# Altium schematic sheet ETHERNET.SchDoc
size 558 x 431 mm; SheetNumber: 3; SheetTotal: 6; SPICEModelCacheANLGLSFY: <root> / <DocumentId>ANLGLSFY</DocumentId> / </root>
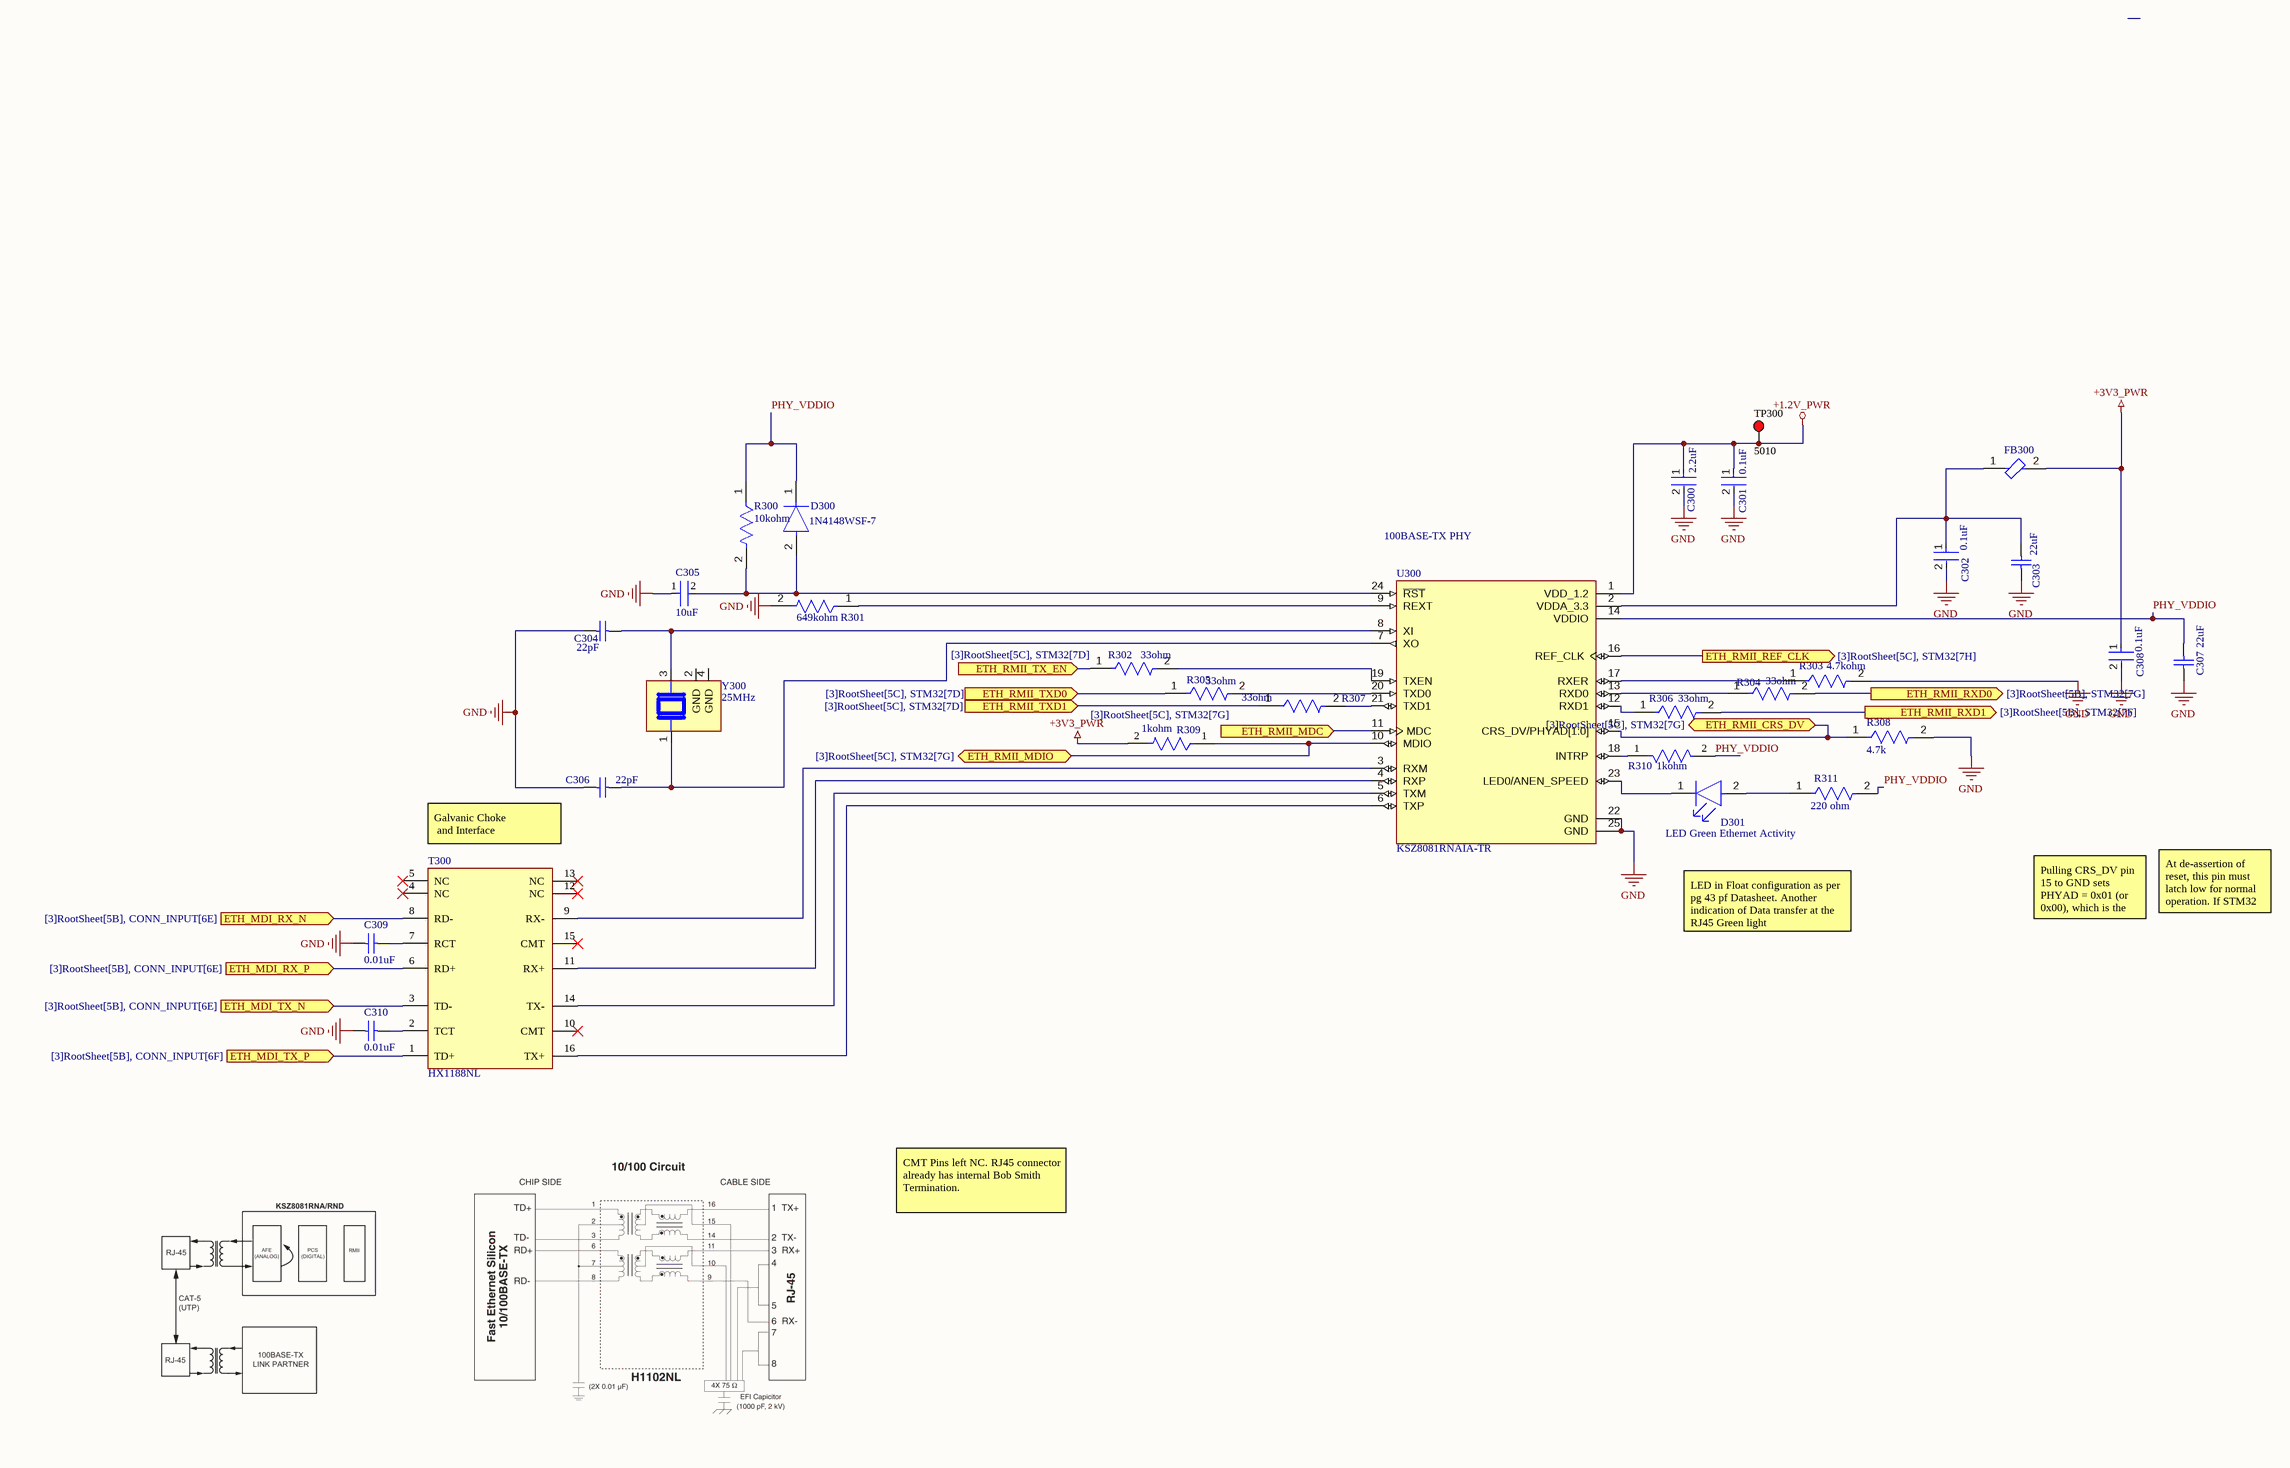
[diagram p0: ETHERNET.SchDoc]

## Parts
C300  2.2uF  [FP-CC0603-DC-MFG]
C301  0.1uF  [FP-GCM188-0_1-IPC_A]
C302  0.1uF  [FP-GCM188-0_1-IPC_A]
C303  22uF  [CAPC1608X90X35ML15T15]
C304  22pF  [CAPC1608X87X35LL15T15]
C305  10uF  [FP-CC0603-DC-MFG]
C306  22pF  [CAPC1608X87X35LL15T15]
C307  22uF  [CAPC1608X90X35ML15T15]
C308  0.1uF  [FP-GCM188-0_1-IPC_A]
C309  0.01uF  [CAPC0603(1608)100_L]
C310  0.01uF  [CAPC0603(1608)100_L]
D300  1N4148WSF-7  [FP-SOD323F-MFG]
D301  LED Green Ethernet Activity  [FP-APHD1608LZGCK-MFG]
FB300  BLM18PG121SN1D  [FP-BLM18-0_15-t0_8-IPC_A]  (value not drawn)
R300  10kohm  [FP-RC0603-0_55-IPC_C]
R301  649kohm  [FP-RT0603-MFG]
R302  33ohm  [FP-CRGCQ0603-IPC_C]
R303  4.7kohm  [FP-RMCF0603-IPC_B]
R304  33ohm  [FP-CRGCQ0603-IPC_C]
R305  33ohm  [FP-CRGCQ0603-IPC_C]
R306  33ohm  [FP-CRGCQ0603-IPC_C]
R307  33ohm  [FP-CRGCQ0603-IPC_C]
R308  4.7k  [FP-RMCF0603-IPC_B]
R309  1kohm  [FP-TFCR0603-MFG]
R310  1kohm  [FP-TFCR0603-MFG]
R311  220 ohm  [FP-RMCF0603-MFG]
T300  HX1188NL  [FP-HX1188NL-MFG]
TP300  5010  [KSTN-5010_V]
U300  KSZ8081RNAIA-TR  [QFN50P400X400X90-25N]
Y300  25MHz  [XTAL_C3E-25.000-12-3030-X-R]

## Ports
ETH_MDI_RX_N (in, see [3]RootSheet[5B], CONN_INPUT[6E]), ETH_MDI_RX_P (in, see [3]RootSheet[5B], CONN_INPUT[6E]), ETH_MDI_TX_N (in, see [3]RootSheet[5B], CONN_INPUT[6E]), ETH_MDI_TX_P (in, see [3]RootSheet[5B], CONN_INPUT[6F]), ETH_RMII_CRS_DV (bidir, see [3]RootSheet[5C], STM32[7G]), ETH_RMII_MDC (in, see [3]RootSheet[5C], STM32[7G]), ETH_RMII_MDIO (bidir, see [3]RootSheet[5C], STM32[7G]), ETH_RMII_REF_CLK (out, see [3]RootSheet[5C], STM32[7H]), ETH_RMII_RXD0 (out, see [3]RootSheet[5B], STM32[7G]), ETH_RMII_RXD1 (out, see [3]RootSheet[5B], STM32[7F]), ETH_RMII_TX_EN (in, see [3]RootSheet[5C], STM32[7D]), ETH_RMII_TXD0 (in, see [3]RootSheet[5C], STM32[7D]), ETH_RMII_TXD1 (in, see [3]RootSheet[5C], STM32[7D])

## Nets
+1.2V_PWR: C300.1 C301.1 TP300.1 U300.1(VDD_1.2)
+3V3_PWR: C308.1 FB300.2 R309.2
GND: C300.2 C301.2 C302.2 C303.1 C304.1 C305.1 C306.1 C307.1 C308.2 C309.1 C310.1 R301.2 R303.2 R308.2 U300.22(GND) U300.25(GND)
ETH_MDI_RX_N: T300.8(RD-) ; port ETH_MDI_RX_N
ETH_MDI_RX_P: T300.6(RD+) ; port ETH_MDI_RX_P
ETH_MDI_TX_N: T300.3(TD-) ; port ETH_MDI_TX_N
ETH_MDI_TX_P: T300.1(TD+) ; port ETH_MDI_TX_P
ETH_RMII_CRS_DV: R308.1 U300.15(CRS_DV/PHYAD[1:0]) ; port ETH_RMII_CRS_DV
ETH_RMII_MDC: U300.11(MDC) ; port ETH_RMII_MDC
ETH_RMII_MDIO: R309.1 U300.10(MDIO) ; port ETH_RMII_MDIO
ETH_RMII_REF_CLK: U300.16(REF_CLK) ; port ETH_RMII_REF_CLK
ETH_RMII_RXD0: R304.2 ; port ETH_RMII_RXD0
ETH_RMII_RXD1: R306.2 ; port ETH_RMII_RXD1
ETH_RMII_TX_EN: R302.1 ; port ETH_RMII_TX_EN
ETH_RMII_TXD0: R305.1 ; port ETH_RMII_TXD0
ETH_RMII_TXD1: R307.1 ; port ETH_RMII_TXD1
PHY_VDDIO: C307.2 D300.1(C) R300.1 R310.2 R311.2 U300.14(VDDIO)
NetC302_1: C302.1 C303.2 FB300.1 U300.2(VDDA_3.3)
NetC304_2: C304.2 U300.8(XI) Y300.3
NetC305_2: C305.2 D300.2(A) R300.2 U300.24(~{RST})
NetC306_2: C306.2 U300.7(XO) Y300.1
NetC309_2: C309.2 T300.7(RCT)
NetC310_2: C310.2 T300.2(TCT)
NetD301_1: D301.1(C) U300.23(LED0/ANEN_SPEED)
NetD301_2: D301.2(A) R311.1
NetR301_1: R301.1 U300.9(REXT)
NetR302_2: R302.2 U300.19(TXEN)
NetR303_1: R303.1 U300.17(RXER)
NetR304_1: R304.1 U300.13(RXD0)
NetR305_2: R305.2 U300.20(TXD0)
NetR306_1: R306.1 U300.12(RXD1)
NetR307_2: R307.2 U300.21(TXD1)
NetR310_1: R310.1 U300.18(INTRP)
NetT300_9: T300.9(RX-) U300.3(RXM)
NetT300_11: T300.11(RX+) U300.4(RXP)
NetT300_14: T300.14(TX-) U300.5(TXM)
NetT300_16: T300.16(TX+) U300.6(TXP)

Not connected (* = marked no-connect by the designer): T300 4(NC)* 5(NC)* 10(CMT)* 12(NC)* 13(NC)* 15(CMT)*; Y300 2(GND) 4(GND)

## Notes on the sheet
- 100BASE-TX PHY
- (near C308) Type @ to refer to a designator
- Galvanic Choke
  and Interface
- Pulling CRS_DV pin 15 to GND sets PHYAD = 0x01 (or 0x00), which is the standard default address expected by the STM32 Ethernet driver library (HAL/LwIP)
- At de-assertion of reset, this pin must latch low for normal operation. If STM32 does not use RXER, tie to GND via a 4.7k ohm resistor.
- LED in Float configuration as per pg 43 pf Datasheet. Another indication of Data transfer at the RJ45 Green light
- CMT Pins left NC. RJ45 connector already has internal Bob Smith Termination.
- DWG. NO.
- REV.
- SHT.
- REVISION
- DESCRIPTION
- DATE
- APPROVED
- THIS DOCUMENT AND THE DATA DISCLOSED HEREIN OR HEREWITH IS THE PROPERTY OF ALTIUM LIMITED AND MAY BE FREELY DISTRIBUTED IN WHOLE. NO RIGHTS ARE RESERVED OR EXPRESS OR IMPLIED WARANTEE GIVEN.
- ENG:
- DSN:
- APPROVALS
- PROJECT
- DOCUMENT REVISION:
- DESIGN ITEM:
- CHK:
- BOM:
- REFERENCE DOCUMENTS
- PROJECT REVISION:
- TITLE
- FAB DWG:
- PCB DWG:
- ASSY DWG:
- SCALE:
- SIZE
- C
- CAGE CODE
- FILE NAME
- DWG NO.
- SHEET
- OF
- REV

## Library data of the parts
C300 = CMP-03422-000578-2: CAP CER 2.2UF 50V X5R 0603; Tolerance: 10%; Packaging: Cut Tape; Capacitance: 2.2uF; Min Operating Temperature: -55°C; RoHS Compliant: Yes; Max Operating Temperature: 85°C; Case Code (Metric): 1608; Voltage Rating: 50V; Case/Package: 0603; Case Code (Imperial): 0603; Mount: Surface Mount
C301 C302 C308 = CMP-2006-02355-2: CAP CER 0.1UF 16V X7R 0603; Tolerance: 10%; Capacitance: 100nF; Thickness: 0.035inch; Lead Free: Lead Free; Dielectric: X7R; Case Code (Metric): 1608; Voltage Rating: 16V; Depth: 0.8mm; Height: 0.8mm; RoHS Compliant: Yes; Termination: SMD/SMT; Case/Package: 0603; Case Code (Imperial): 0603; Package Quantity: 4000; Voltage: 16V; Radiation Hardening: No; Series: GCM; Length: 1.6mm; Mount: Surface Mount; Construction: Flat; Ratings: AEC-Q200; Min Operating Temperature: -55°C; Packaging: Tape and Reel; Voltage Rating (DC): 16V; Max Operating Temperature: 125°C; Width: 0.031inch; REACH SVHC: No SVHC
C303 C307 = CMP-2006-04205-1: Manufacturer: AVX Interconnect / Elco; Part Number: 06034D226MAT2A
C304 C306 = CMP-2006-03615-1: Manufacturer: Kemet; Part Number: C0603X220J5GACTU
C305 = CMP-00621-81932632-1: CC0603KRX5R7BB106 Multilayer Ceramic Capacitor, 10 uF, 16 V, ± 10%, X5R, 0603 [1608 Metric]; Capacitance: 10µF; Voltage Rating: 16V; NexarPartId: 81932632; Height: 1mm; Halogen Free: Halogen Free; Dielectric: X5R; Max Operating Temperature: 85°C; Voltage Rating (DC): 16V; Material: Ceramic; Lead Free: Lead Free; Tolerance: 10%; RoHS: Non-Compliant; Min Operating Temperature: -55°C; Case/Package: 0603
C309 C310 = CMP-1035-02591-1: CAP 100nF 50V ±5% 0603 (1608 Metric) Thickness 1mm SMD; Tolerance: Â±5%; Case-Metric: 1608; Case-EIA: 0603; Rated Voltage: 50 V; Max Thickness: 1 mm; Technology: SMT; Value: 100nF
D300 = CMP-12791-000029-1: DIODE GEN PURP 100V 250MA SOD323; Manufacturer: Diodes Inc.; Value: 1.5pF; Max Surge Forward Current: 0.5A; Peak Reverse Current: 0.5uA; Max Junction Temp: +150°C; Height: 0.75mm; Digikey Description: DIODE GEN PURP 100V 250MA SOD323; Automotive: No; Footprint Url: https://www.diodes.com/assets/Package-Files/SOD323F.pdf; Category: Diode; Manufacturer Part Number: 1N4148WSF-7; Max Repetitive Reverse Voltage: 100V; Lead Free: Yes; Temperature Range High: +150°C; Forward Current: 250mA; Reverse Voltage: 100V; Device Class L3: Rectifier Diodes; ComponentLink2URL: https://www.diodes.com/assets/Datasheets/1N4148WSF.pdf; Package: SOD323F; RoHS: TRUE; Mouser Description: Diodes - General Purpose, Power, Switching 200mW 2pF 75Vrrm 150mA 2A 1VF; Temperature: -55°C to +150°C; Capacitance: 1.5pF; Device Class L2: Diodes; ComponentLink2Description: Datasheet; Device Class L1: Discrete Semiconductors; Octopart: https://octopart.com/1n4148wsf-7-diodes+inc.-33798544; Temperature Range Low: -55°C
D301 = CMP-44529-000045-1: LED GREEN CLEAR 1608 SMD; Test Current: 2mA; Dominant Wavelength: 525nm; Lens Color: Colorless; Luminous Intensity: 180mcd; Viewing Angle: 100°; Forward Voltage: 2.65V; Lens Size: 0.7mm; Lens Style: Round; Mount: Surface Mount; Packaging: Tape and Reel; Lens Transparency: Clear; Height: 0.75mm; Case/Package: 0603; Length: 1.6mm; Case Code (Metric): 1608; Width: 0.8mm; Color: Green; Case Code (Imperial): 0603
FB300 = CMP-0686-00557-7: Chip Ferrite Bead, 0603, 120Ω @ 100MHz, 0.05Ω, 25%, 2A; Impedance: 120R; Number of Circuits: 1; Shielding: Unshielded; Material: Steel; DC Resistance (DCR): 50mR; Case Code (Imperial): 0603; RoHS Compliant: Yes; Number of Pins: 2; Min Operating Temperature: -55°C; Case Code (Metric): 1608; Frequency: 100MHz; Length: 1.6mm; Test Frequency: 100MHz; Max Operating Temperature: 125°C; Packaging: Tape and Reel; Max Current Rating: 2A; Termination: SMD/SMT; Lead Free: Lead Free; Max DC Current: 2A; Case/Package: 0603; Height: 0.8mm; Current Rating: 2A; Radiation Hardening: No; Core Material: Ferrite; DC Current: 2A; REACH SVHC: No SVHC; Package Quantity: 1; Depth: 0.8mm; Number of Lines: 1; Tolerance: 25%; Width: 0.8mm
R300 = CMP-2100-03664-2: RES 10K OHM 1% 1/10W 0603; Voltage Rating: 75V; Voltage Rating (DC): 50V; Resistance: 10kR; Power Rating: 100mW; Temperature Coefficient: 100ppm/°C; Depth: 0.8mm; Termination: SMD/SMT; Resistor Type: Thick Film; Series: RC; Construction: Rectangular; Features: Moisture Resistant; Packaging: Tape and Reel; Min Operating Temperature: -55°C; Number of Terminations: 2; Lead Pitch: 0.3mm; RoHS Compliant: Yes; Case/Package: 0603; Resistance Tolerance: 1%; Military Standard: Not; Weight: 7.1E-05oz; Number of Pins: 2; Tolerance: 1%; Length: 1.6mm; Case Code (Imperial): 0603; Lead Free: Lead Free; Width: 0.8mm; Max Power Dissipation: 100mW; Height: 0.45mm; Max Operating Temperature: 155°C; Case Code (Metric): 1608; Size Code: 0603
R301 = CMP-03412-015599-1: RES SMD 649K OHM 0.1% 1/10W 0603; Manufacturer Part Number: RT0603BRD07649KL; Manufacturer: Yageo; Temperature Coefficient: 25 ppm/°C; Tolerance: 0.001; Resistance: 649KΩ; Power Rating: 0.1W; Value: 649KΩ; Voltage Rating: 75V; Composition: Thin Film; Temperature Range Low: -55°C; Lead Free: Yes; Device Class L1: Passive Components; Digikey Description: RES SMD 649K OHM 0.1% 1/10W 0603; Octopart: https://octopart.com/rt0603brd07649kl-yageo-71394375; Package: RT0603; Series: RT; Temperature Range High: +155°C; Mouser Description: Thin Film Resistors 1/10W 649K ohm .1% 25ppm; Height: 0.55mm; Automotive: No; RoHS: TRUE; ComponentLink2URL: http://www.yageo.com/documents/recent/PYu-RT_1-to-0.01_RoHS_L_9.pdf; Device Class L2: Resistors; Footprint Url: http://www.yageo.com/exep/pages/download/literatures/PYu-R_Mount_10.pdf; Category: Res; Ipc Land Pattern Name: RESC16080X45; Temperature: -55°C to +155°C; ComponentLink2Description: Datasheet; Device Class L3: Chip SMD Resistors
R302 R304-R307 = CMP-03211-000637-1: CRGCQ0603 33Ω 5% ±200ppm/°C 75V; Manufacturer: TE Connectivity; Manufacturer Part Number: CRGCQ0603J33R; Power Rating: 0.1W; Tolerance: 0.05; Series: CRGCQ; Temperature Range Low: -55°C; Device Class L2: Resistors; Voltage Rating: 75V; Package: CRGCQ0603; Value: 33Ω; Height: 0.55mm; Lead Free: Yes; Ambient Temperature Range High: +70°C; Resistance: 33Ω; ComponentLink2Description: Datasheet; Category: Res; Ipc Land Pattern Name: RESC16080X45; Composition: Thick Film; Device Class L3: Chip SMD Resistors; Temperature Range High: +155°C; Octopart: https://octopart.com/crgcq0603j33r-te+connectivity-91018120; Device Class L1: Passive Components; Temperature Coefficient: ±200ppm/°C; Temperature: -55°C to +155°C; RoHS: TRUE; ComponentLink2URL: https://www.te.com/commerce/DocumentDelivery/DDEController?Action=showdoc&DocId=Data+Sheet%7F1773204-3%7F1%7Fpdf%7FEnglish%7FENG_DS_1773204-3_1.pdf%7F4-2176339-353
R303 R308 = CMP-26527-004068-1: 4.7kΩ ±1% 0.1W 0603 Thick Film Chip Resistor AEC-Q200 compliant; Resistance: 4.7kR; Temperature Coefficient: 100ppm/°C; Max Power Dissipation: 100mW; Length: 0.061inch; Tolerance: 1%; Series: RMCF; Resistor Type: Thick Film; Packaging: Tape and Reel; Features: Automotive AEC-Q200; Max Operating Temperature: 155°C; Number of Terminations: 2; RoHS Compliant: Yes; Case/Package: 0603; Width: 0.031inch; Height: 0.022inch; Min Operating Temperature: -55°C; Mount: Surface Mount
R309 R310 = CMP-250906-155217-1: RES Thin Film,  1kΩ, 1%, 0.1W, 25ppm/°C, 0603
R311 = CMP-26527-002055-1: 220Ω ±5% 0.1W 0603 Thick Film Chip Resistor AEC-Q200 compliant; Resistance: 220R; Temperature Coefficient: 100ppm/°C; Min Operating Temperature: -55°C; Contact Plating: Tin; Max Operating Temperature: 155°C; Radiation Hardening: No; Tolerance: 5%; RoHS Compliant: Yes; Packaging: Tape and Reel; Mount: Surface Mount; Case/Package: 0603; Resistor Type: Thick Film
T300 = CMP-2000-05323-2: MODULE XFRMR SGL ETHR LAN 16SOIC; Turns Ratio: 1:1; Insertion Loss: -1dB; Isolation Voltage: 1.5kV; DC Resistance (DCR): 1.5R; Return Loss: -12dB; Shielding: Unshielded; Lead/Base Style: Gull Wing; Series: -; Depth: 9.53mm; Radiation Hardening: No; Height - Seated (Max): 6.22mm; Package Quantity: 40; Mount: Surface Mount; Width: 7.11mm; Lead Free: Lead Free; Number of Pins: 16; RoHS Compliant: Yes; Termination: SMD/SMT; Min Operating Temperature: -40°C; Packaging: Rail/Tube; Height: 5.97mm; Case/Package: Module; Max Operating Temperature: 85°C; Length: 12.7mm
TP300 = CMP-1672-00002-4: Test Point, Red, Through Hole, RoHS, Bulk; Manufacturer: Keystone; Contact Material: Bronze; Mounting Technology: Through Hole; RoHSCompliant: true; Pins: 1; Package Quantity: 100; ComponentLink2Description: Datasheet; Height: 8.12 mm; ComponentLink1URL: http://www.keyelco.com/; DatasheetVersion: Rev. F, 12/2013; Mount: Through Hole; PackageReference: 5010; Contact Plating: Silver; Packaging: Bulk; Colour: Red; REACH SVHC: No SVHC; PackageDescription: 1-Pin Through Hole Device, Dia 3.17 mm; ComponentLink2URL: http://www.keyelco.com/product-pdf.cfm?p=1319; ComponentLink1Description: Manufacturer URL
U300 = KSZ8081RNAIA-TR: 1/1 Transceiver Full RMII 24-QFN (4x4); MF: Microchip; SnapEDA_Link: https://www.snapeda.com/parts/KSZ8081RNAIA-TR/Microchip+Technology/view-part/?ref=snap; Package: QFN-24 Microchip; Value: *; MP: KSZ8081RNAIA-TR; Check_prices: https://www.snapeda.com/parts/KSZ8081RNAIA-TR/Microchip+Technology/view-part/?ref=eda
Y300 = C3E-25.000-12-3030-X-R: Package: None; Price: None; Value: *; MP: C3E-25.000-12-3030-X-R; Availability: Unavailable